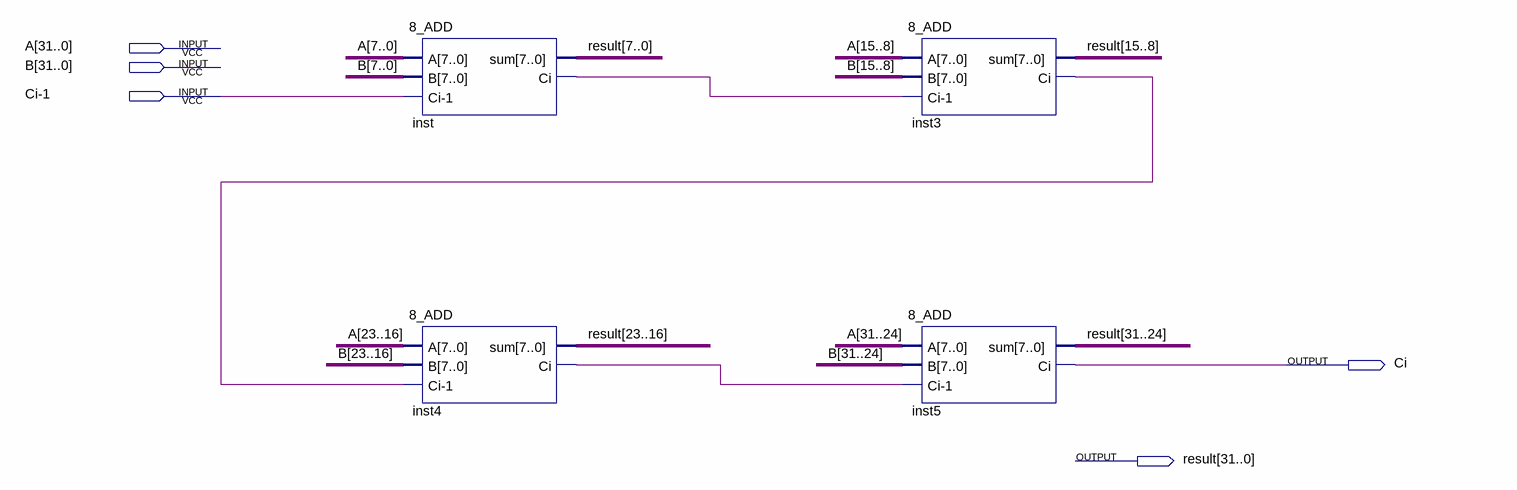
[diagram p0: schematic sheet]
// Quartus schematic 32_ADD.bdf as structural Verilog: 4 symbols, 5 pins
module \32_ADD  (
  input  [31:0] A,
  input  [31:0] B,
  input  \Ci-1 ,
  output Ci,
  output [31:0] result
);

  wire inst3_ci, inst4_ci, inst_ci;

  \8_ADD  inst (.A(A[7:0]), .B(B[7:0]), .\Ci-1 (\Ci-1 ), .sum(result[7:0]), .Ci(inst_ci));
  \8_ADD  inst4 (.A(A[23:16]), .B(B[23:16]), .\Ci-1 (inst3_ci), .sum(result[23:16]), .Ci(inst4_ci));
  \8_ADD  inst3 (.A(A[15:8]), .B(B[15:8]), .\Ci-1 (inst_ci), .sum(result[15:8]), .Ci(inst3_ci));
  \8_ADD  inst5 (.A(A[31:24]), .B(B[31:24]), .\Ci-1 (inst4_ci), .sum(result[31:24]), .Ci(Ci));
endmodule
